# Altium schematic sheet Sheet2.SchDoc: x-fly
size A4; DrawnBy: sushishu; SheetNumber: 2; SheetTotal: 3
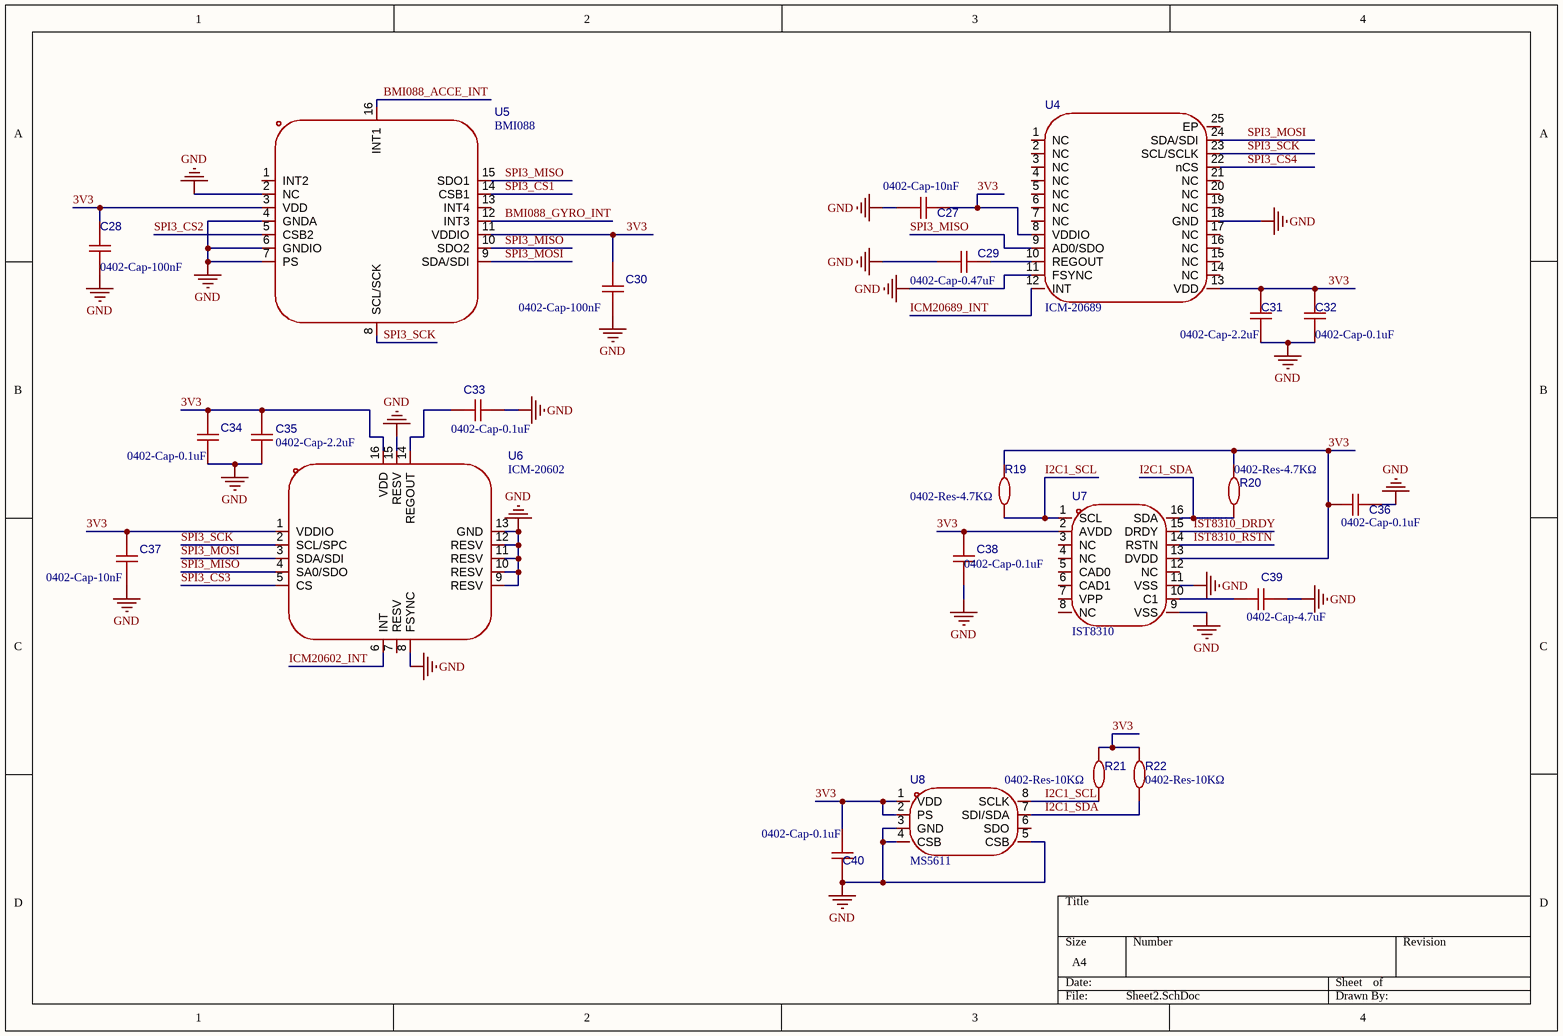
[diagram p0: Sheet2.SchDoc]

## Parts
C27  0402-Cap-10nF  [0402-Cap]
C28  0402-Cap-100nF  [0402-Cap]
C29  0402-Cap-0.47uF  [0402-Cap]
C30  0402-Cap-100nF  [0402-Cap]
C31  0402-Cap-2.2uF  [0402-Cap]
C32  0402-Cap-0.1uF  [0402-Cap]
C33  0402-Cap-0.1uF  [0402-Cap]
C34  0402-Cap-0.1uF  [0402-Cap]
C35  0402-Cap-2.2uF  [0402-Cap]
C36  0402-Cap-0.1uF  [0402-Cap]
C37  0402-Cap-10nF  [0402-Cap]
C38  0402-Cap-0.1uF  [0402-Cap]
C39  0402-Cap-4.7uF  [0402-Cap]
C40  0402-Cap-0.1uF  [0402-Cap]
R19  0402-Res-4.7KΩ  [0402-Res]
R20  0402-Res-4.7KΩ  [0402-Res]
R21  0402-Res-10KΩ  [0402-Res]
R22  0402-Res-10KΩ  [0402-Res]
U4  ICM-20689  [ICM-20689]
U5  BMI088  [BMI088]
U6  ICM-20602  [ICM-20602]
U7  IST8310  [IST8310]
U8  MS5611  [MS5611]

## Nets
GND: C27.2 C28.1 C29.2 C30.1 C31.1 C32.1 C33.2 C34.1 C35.1 C36.1 C37.1 C38.2 C39.2 C40.2 U4.11(FSYNC) U4.18(GND) U5.2(NC) U5.4(GNDA) U5.6(GNDIO) U5.7(PS) U6.8(FSYNC) U6.9(RESV) U6.10(RESV) U6.11(RESV) U6.12(RESV) U6.13(GND) U6.15(RESV) U7.9(VSS) U7.11(VSS) U8.3(GND) U8.4(CSB) U8.5(CSB)
3V3: C27.1 C28.2 C30.2 C31.2 C32.2 C34.2 C35.2 C36.2 C37.2 C38.1 C40.1 R19.2 R20.2 R21.2 R22.1 U4.8(VDDIO) U4.13(VDD) U5.3(VDD) U5.11(VDDIO) U6.1(VDDIO) U6.16(VDD) U7.2(AVDD) U7.13(DVDD) U8.1(VDD) U8.2(PS)
BMI088_ACCE_INT: U5.16(INT1)
BMI088_GYRO_INT: U5.12(INT3)
I2C1_SCL: R19.1 R21.1 U7.1(SCL) U8.8(SCLK)
I2C1_SDA: R20.1 R22.2 U7.16(SDA) U8.7(SDI/SDA)
ICM20602_INT: U6.6(INT)
ICM20689_INT: U4.12(INT)
IST8310_DRDY: U7.15(DRDY)
IST8310_RSTN: U7.14(RSTN)
SPI3_CS1: U5.14(CSB1)
SPI3_CS2: U5.5(CSB2)
SPI3_CS3: U6.5(CS)
SPI3_CS4: U4.22(nCS)
SPI3_MISO: U4.9(AD0/SDO) U5.10(SDO2) U5.15(SDO1) U6.4(SA0/SDO)
SPI3_MOSI: U4.24(SDA/SDI) U5.9(SDA/SDI) U6.3(SDA/SDI)
SPI3_SCK: U4.23(SCL/SCLK) U5.8(SCL/SCK) U6.2(SCL/SPC)
NetC29_1: C29.1 U4.10(REGOUT)
NetC33_1: C33.1 U6.14(REGOUT)
NetC39_1: C39.1 U7.10(C1)

Not connected (* = marked no-connect by the designer): U4 1(NC) 2(NC) 3(NC) 4(NC) 5(NC) 6(NC) 7(NC) 14(NC) 15(NC) 16(NC) 17(NC) 19(NC) 20(NC) 21(NC) 25(EP); U5 1(INT2) 13(INT4); U6 7(RESV); U7 3(NC) 4(NC) 5(CAD0) 6(CAD1) 7(VPP) 8(NC) 12(NC); U8 6(SDO)

## Library data of the parts
C27-C40 = 0402-Cap: Symbol: CGA0402X5R106M6R3GT
R19-R22 = 0402-Res: Symbol: 0402WGF1002TCE
U7 = IST8310: Symbol: IST8310_C2683055
U8 = MS5611: Symbol: MS561101BA03-50
U4 = ICM-20689: Symbol: ICM-20689
U5 = BMI088: Symbol: BMI088
U6 = ICM-20602: Symbol: ICM-20602